# Altium schematic sheet EthIO_05_DI_DO.SchDoc
size A4; SheetNumber: 9; SheetTotal: 9
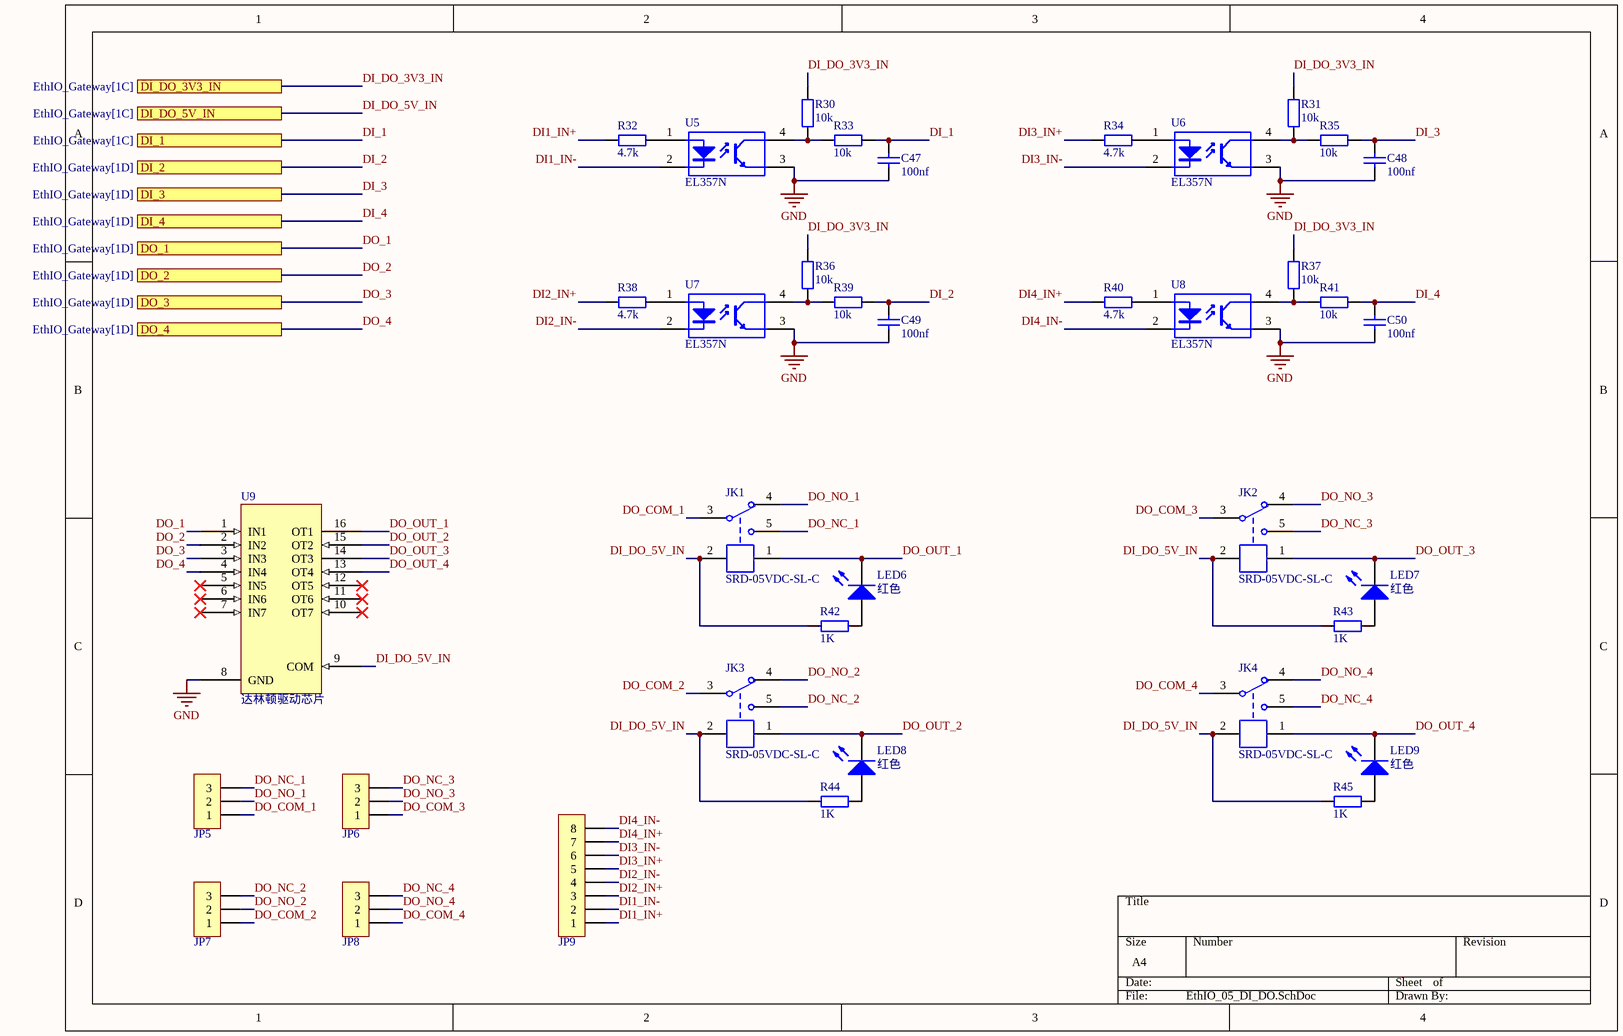
[diagram p0: EthIO_05_DI_DO.SchDoc]

## Parts
C47  100nf  [C0805_L]
C48  100nf  [C0805_L]
C49  100nf  [C0805_L]
C50  100nf  [C0805_L]
JK1  SRD-05VDC-SL-C  [SRD-C_B]
JK2  SRD-05VDC-SL-C  [SRD-C_B]
JK3  SRD-05VDC-SL-C  [SRD-C_B]
JK4  SRD-05VDC-SL-C  [SRD-C_B]
JP5  HDR-1X3  [KF350-3P]  (value not drawn)
JP6  HDR-1X3  [KF350-3P]  (value not drawn)
JP7  HDR-1X3  [KF350-3P]  (value not drawn)
JP8  HDR-1X3  [KF350-3P]  (value not drawn)
JP9  HDR-1X8  [KF350-8P]  (value not drawn)
LED6  红色  [LED0805_G]
LED7  红色  [LED0805_G]
LED8  红色  [LED0805_G]
LED9  红色  [LED0805_G]
R30  10k  [R0805_L]
R31  10k  [R0805_L]
R32  4.7k  [R0805_L]
R33  10k  [R0805_L]
R34  4.7k  [R0805_L]
R35  10k  [R0805_L]
R36  10k  [R0805_L]
R37  10k  [R0805_L]
R38  4.7k  [R0805_L]
R39  10k  [R0805_L]
R40  4.7k  [R0805_L]
R41  10k  [R0805_L]
R42  1K  [R0805_L]
R43  1K  [R0805_L]
R44  1K  [R0805_L]
R45  1K  [R0805_L]
U5  EL357N  [DIP4-300]
U6  EL357N  [DIP4-300]
U7  EL357N  [DIP4-300]
U8  EL357N  [DIP4-300]
U9  达林顿驱动芯片  [DIP-16]

## Ports
DI_1 (see EthIO_Gateway[1C]), DI_2 (see EthIO_Gateway[1D]), DI_3 (see EthIO_Gateway[1D]), DI_4 (see EthIO_Gateway[1D]), DI_DO_3V3_IN (see EthIO_Gateway[1C]), DI_DO_5V_IN (see EthIO_Gateway[1C]), DO_1 (see EthIO_Gateway[1D]), DO_2 (see EthIO_Gateway[1D]), DO_3 (see EthIO_Gateway[1D]), DO_4 (see EthIO_Gateway[1D])

## Nets
GND: C47.2 C48.2 C49.2 C50.2 U5.3(E) U6.3(E) U7.3(E) U8.3(E) U9.8(GND)
DI1_IN+: JP9.1 R32.1
DI1_IN-: JP9.2 U5.2(K)
DI2_IN+: JP9.3 R38.1
DI2_IN-: JP9.4 U7.2(K)
DI3_IN+: JP9.5 R34.1
DI3_IN-: JP9.6 U6.2(K)
DI4_IN+: JP9.7 R40.1
DI4_IN-: JP9.8 U8.2(K)
DI_1: C47.1 R33.2 ; port DI_1
DI_2: C49.1 R39.2 ; port DI_2
DI_3: C48.1 R35.2 ; port DI_3
DI_4: C50.1 R41.2 ; port DI_4
DI_DO_3V3_IN: R30.2 R31.2 R36.2 R37.2 ; port DI_DO_3V3_IN
DI_DO_5V_IN: JK1.2 JK2.2 JK3.2 JK4.2 R42.2 R43.2 R44.2 R45.2 U9.9(COM) ; port DI_DO_5V_IN
DO_1: U9.1(IN1) ; port DO_1
DO_2: U9.2(IN2) ; port DO_2
DO_3: U9.3(IN3) ; port DO_3
DO_4: U9.4(IN4) ; port DO_4
DO_COM_1: JK1.3 JP5.1
DO_COM_2: JK3.3 JP7.1
DO_COM_3: JK2.3 JP6.1
DO_COM_4: JK4.3 JP8.1
DO_NC_1: JK1.5 JP5.3
DO_NC_2: JK3.5 JP7.3
DO_NC_3: JK2.5 JP6.3
DO_NC_4: JK4.5 JP8.3
DO_NO_1: JK1.4 JP5.2
DO_NO_2: JK3.4 JP7.2
DO_NO_3: JK2.4 JP6.2
DO_NO_4: JK4.4 JP8.2
DO_OUT_1: JK1.1 LED6.2(K) U9.16(OT1)
DO_OUT_2: JK3.1 LED8.2(K) U9.15(OT2)
DO_OUT_3: JK2.1 LED7.2(K) U9.14(OT3)
DO_OUT_4: JK4.1 LED9.2(K) U9.13(OT4)
NetLED6_1: LED6.1(A) R42.1
NetLED7_1: LED7.1(A) R43.1
NetLED8_1: LED8.1(A) R44.1
NetLED9_1: LED9.1(A) R45.1
NetR30_1: R30.1 R33.1 U5.4(C)
NetR31_1: R31.1 R35.1 U6.4(C)
NetR32_2: R32.2 U5.1(A)
NetR34_2: R34.2 U6.1(A)
NetR36_1: R36.1 R39.1 U7.4(C)
NetR37_1: R37.1 R41.1 U8.4(C)
NetR38_2: R38.2 U7.1(A)
NetR40_2: R40.2 U8.1(A)

Not connected (* = marked no-connect by the designer): U9 5(IN5)* 6(IN6)* 7(IN7)* 10(OT7)* 11(OT6)* 12(OT5)*

## Library data of the parts
C47-C50 = C: 贴片电容/MLCC电容; BOM名称: 无极性贴片电容; 当前库版本V2022.12.25 @淘宝卖家:黄晶宝石: 最新版本发布https://shop463601444.taobao.com
JK1-JK4 = SRD-05VDC-SL-C: 5V一组转换; BOM名称: 5V继电器; 联系卖家 免费查找封装: 获取最新版本https://shop463601444.taobao.com
JP5-JP8 = Header 3: 3P接插件; 封装库来自淘宝卖家： 黄晶宝石: 其他店铺购入均为盗版封装库，无更新权益，退款现金奖励200~1000元; BOM名称: 3P接插件
JP9 = Header 8: 8P接插件; 封装库来自淘宝卖家： 黄晶宝石: 其他店铺购入均为盗版封装库，无更新权益，退款现金奖励200~1000元; BOM名称: 8P接插件
LED6-LED9 = LED: 贴片LED; 封装库来自淘宝卖家：黄晶宝石: 其他店铺购入均为盗版封装库，无更新权益，请立即申请退款，本店现金奖励200~1000元; BOM名称: 贴片LED
R30-R45 = R: 贴片电阻; 联系下单店铺卖家 免费帮你查找封装: 联系下单店铺卖家 免费技术支持; BOM名称: 贴片电阻
U5-U8 = EL357N: 线性光耦; 封装库来自淘宝卖家：黄晶宝石: 其他店铺购入均为盗版封装库，无更新权益，请立即申请退款，本店现金奖励200~1000元; BOM名称: 线性光耦
U9 = ULN2003: 封装库来自淘宝卖家：黄晶宝石: 其他店铺购入均为盗版封装库，无更新权益，退款现金奖励200~1000元; 当前库版本V2022.12.25 @淘宝卖家:黄晶宝石: 最新版本发布https://shop463601444.taobao.com